# Altium schematic sheet Controller_Section.SchDoc
size A4; DocumentNumber: 3; SheetNumber: 3; SheetTotal: 5
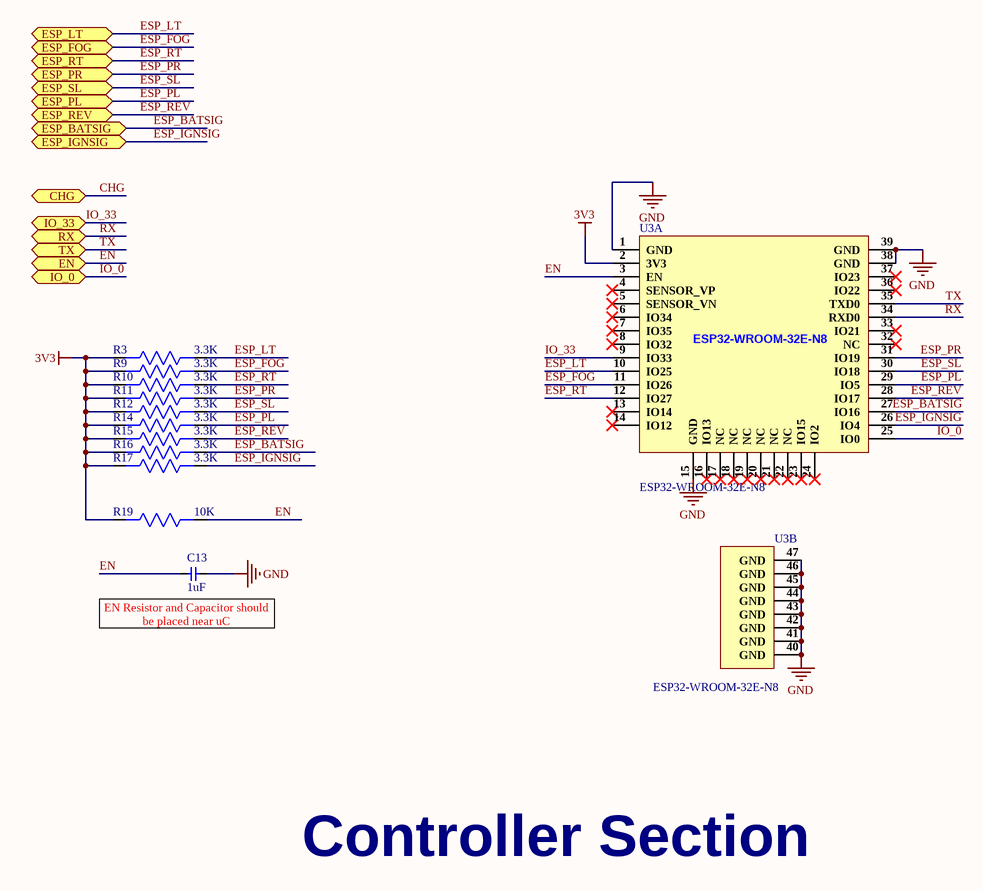
[diagram p0: Controller_Section.SchDoc]

## Parts
C13  1uF  [Cap-0603]
R3  3.3K  [Res0603]
R9  3.3K  [Res0603]
R10  3.3K  [Res0603]
R11  3.3K  [Res0603]
R12  3.3K  [Res0603]
R14  3.3K  [Res0603]
R15  3.3K  [Res0603]
R16  3.3K  [Res0603]
R17  3.3K  [Res0603]
R19  10K  [Resistor0805]
U3  ESP32-WROOM-32E-N8  [38-SMD Module]  (parts A,B of 2)

## Ports
CHG (bidir), EN (bidir), ESP_BATSIG (bidir), ESP_FOG (bidir), ESP_IGNSIG (bidir), ESP_LT (bidir), ESP_PL (bidir), ESP_PR (bidir), ESP_REV (bidir), ESP_RT (bidir), ESP_SL (bidir), IO_0 (bidir), IO_33 (bidir), RX (bidir), TX (bidir)

## Nets
3V3: R3.2 R9.2 R10.2 R11.2 R12.2 R14.2 R15.2 R16.2 R17.2 R19.2 U3.2(3V3)
GND: C13.2 U3.1(GND) U3.15(GND) U3.38(GND) U3.39(GND) U3.40(GND) U3.41(GND) U3.42(GND) U3.43(GND) U3.44(GND) U3.45(GND) U3.46(GND) U3.47(GND)
CHG: port CHG
EN: C13.1 R19.1 U3.3(EN) ; port EN
ESP_BATSIG: R16.1 U3.27(IO16) ; port ESP_BATSIG
ESP_FOG: R9.1 U3.11(IO26) ; port ESP_FOG
ESP_IGNSIG: R17.1 U3.26(IO4) ; port ESP_IGNSIG
ESP_LT: R3.1 U3.10(IO25) ; port ESP_LT
ESP_PL: R14.1 U3.29(IO5) ; port ESP_PL
ESP_PR: R11.1 U3.31(IO19) ; port ESP_PR
ESP_REV: R15.1 U3.28(IO17) ; port ESP_REV
ESP_RT: R10.1 U3.12(IO27) ; port ESP_RT
ESP_SL: R12.1 U3.30(IO18) ; port ESP_SL
IO_0: U3.25(IO0) ; port IO_0
IO_33: U3.9(IO33) ; port IO_33
RX: U3.34(RXD0) ; port RX
TX: U3.35(TXD0) ; port TX

Not connected (* = marked no-connect by the designer): U3 4(SENSOR_VP)* 5(SENSOR_VN)* 6(IO34)* 7(IO35)* 8(IO32)* 13(IO14)* 14(IO12)* 16(IO13)* 17(NC)* 18(NC)* 19(NC)* 20(NC)* 21(NC)* 22(NC)* 23(IO15)* 24(IO2)* 32(NC)* 33(IO21)* 36(IO22)* 37(IO23)*

## Notes on the sheet
- (near C13) EN Resistor and Capacitor should be placed near uC
- Controller Section

## Library data of the parts
C13 = CC0603KRX5R6BB105: CAP CER 1UF 10V X5R 0603; Manufacturer: Yageo; Tolerance: 10%; Item Type: Capacitor; Supplier 1: Avnet; Manufacturer Part Number: CC0603KRX5R6BB105; RoHS: Yes; Category: Ceramic Capacitors; Stock 1: 88000; Pricing 1: 4000=0.01005, 8000=0.00977, 16000=0.00949, 24000=0.00922, 32000=0.00894 (USD); Mount: Surface Mount; Case/Package: 0603; Number of Pins: 2; Case Code (Imperial): 0603; Case Code (Metric): 1608; Min Operating Temperature: -55°C; Max Operating Temperature: 85°C; Capacitance: 1uF; Dielectric: X5R; Voltage Rating: 10V; Voltage Rating (DC): 10V; Packaging: Tape and Reel; Package Quantity: 4000; Termination: SMD/SMT; Resistor Type: Ceramic; Voltage: 10V; Series: CC; Length: 1.6mm; Width: 0.031inch; Height: 0.8mm; Thickness: 0.035inch; Depth: 0.8mm; Radiation Hardening: No; Reach SVHC Compliant: Yes; Lead Free: Lead Free; Halogen Free: Halogen Free; RoHS Compliant: Yes; ComponentLink1URL: https://datasheet.ciiva.com/176/mlccorderingcode-176685.pdf?src-supplier=Digi-Key; ComponentLink1Description: https://datasheet.ciiva.com/176/mlccorderingcode-176685.pdf?src-supplier=Digi-Key; ComponentLink2URL: https://datasheet.ciiva.com/176/mlccorderingcode-176684.pdf?src-supplier=Digi-Key; ComponentLink2Description: https://datasheet.ciiva.com/176/mlccorderingcode-176684.pdf?src-supplier=Digi-Key; ComponentLink3URL: https://datasheet.ciiva.com/176/mlccorderingcode-176686.pdf?src-supplier=Digi-Key; ComponentLink3Description: https://datasheet.ciiva.com/176/mlccorderingcode-176686.pdf?src-supplier=Digi-Key; ComponentLink4URL: https://datasheet.ciiva.com/11587/upy-gphc-x5r-4v-to-50v-12-11587194.pdf?src-supplier=Avnet; ComponentLink4Description: https://datasheet.ciiva.com/11587/upy-gphc-x5r-4v-to-50v-12-11587194.pdf?src-supplier=Avnet; Supplier Part Number 1: CC0603KRX5R6BB105; LCSC Part Number: C106214
R3 R9-R12 R14-R17 = RC0603FR-073K3L: RES SMD 3.3K OHM 1% 1/10W 0603; Manufacturer: Yageo Phycomp; Temperature Coefficient: 100ppm/°C; Resistance: 3.3kR; Voltage Rating (DC): 50V; Power Rating: 100mW; Supplier 1: Digi-Key; Manufacturer Part Number: RC0603FR-073K3L; Stock 1: 6863000; Pricing 1: 1=0.1, 10=0.024, 100=0.0097, 1000=0.00437, 2500=0.00379 (USD); Mount: Surface Mount; Case/Package: 0603; Number of Pins: 2; Min Operating Temperature: -55°C; Max Operating Temperature: 155°C; Tolerance: 1%; Packaging: Cut Tape; Length: 1.6mm; Height: 0.45mm; Width: 800um; Depth: 0.8mm; REACH SVHC: No SVHC; Lead Free: Lead Free; Supplier Part Number 1: 311-3.30KHRCT-ND
R19 = RT0805BRB0710KL: RES SMD 10K OHM 0.1% 1/8W 0805; Manufacturer: Yageo; Resistance: 10kR; Temperature Coefficient: 10ppm/°C; Power Rating: 125mW; Voltage Rating: 150V; Supplier 1: Digi-Key; Manufacturer Part Number: RT0805BRB0710KL; Stock 1: 13114; Pricing 1: 1=0.73, 10=0.606, 100=0.4071, 1000=0.23925 (USD); Case/Package: 0805; Weight: 0.000194oz; Contact Plating: Tin,Matte; Case Code (Imperial): 0805; Case Code (Metric): 2012; Min Operating Temperature: -55°C; Max Operating Temperature: 125°C; Tolerance: 0.1%; Composition: Thin Film; Packaging: Tape and Reel; Package Quantity: 1; Termination: SMD/SMT; Number of Terminations: 2; Military Standard: Not; Max Power Dissipation: 125mW; Features: Moisture Resistant; Length: 2mm; Height: 0.024inch; Width: 1.25mm; Depth: 1.25mm; Radiation Hardening: No; ComponentLink1URL: http://www.yageo.com/documents/recent/PYu-RT_1-to-0.05_RoHS_L_6.pdf?src-supplier=Avnet; ComponentLink1Description: http://www.yageo.com/documents/recent/PYu-RT_1-to-0.05_RoHS_L_6.pdf?src-supplier=Avnet; Supplier Part Number 1: 311-10KNFCT-ND
U3 = ESP32-WROOM-32E-N8: SMD,18x25.5mm WiFi Modules ROHS; Manufacturer: Espressif Systems; Item Type: Module; Supplier 1: Mouser; Manufacturer Part Number: ESP32-WROOM-32E-N8; RoHS: No; Category: Uncategorized; Stock 1: 24616; Pricing 1: 1=3.30000, 10=3.30000, 50=3.30000, 100=3.30000, 1000=3.30000, 10000=3.30000 (USD); Supplier Part Number 1: 356-ESP32WRM32E164PH; LCSC Part Number: C701342; ComponentLink1Description: LCSC; ComponentLink1URL: https://www.lcsc.com/product-detail/WiFi-Modules_Espressif-Systems-ESP32-WROOM-32E-N8_C701342.html